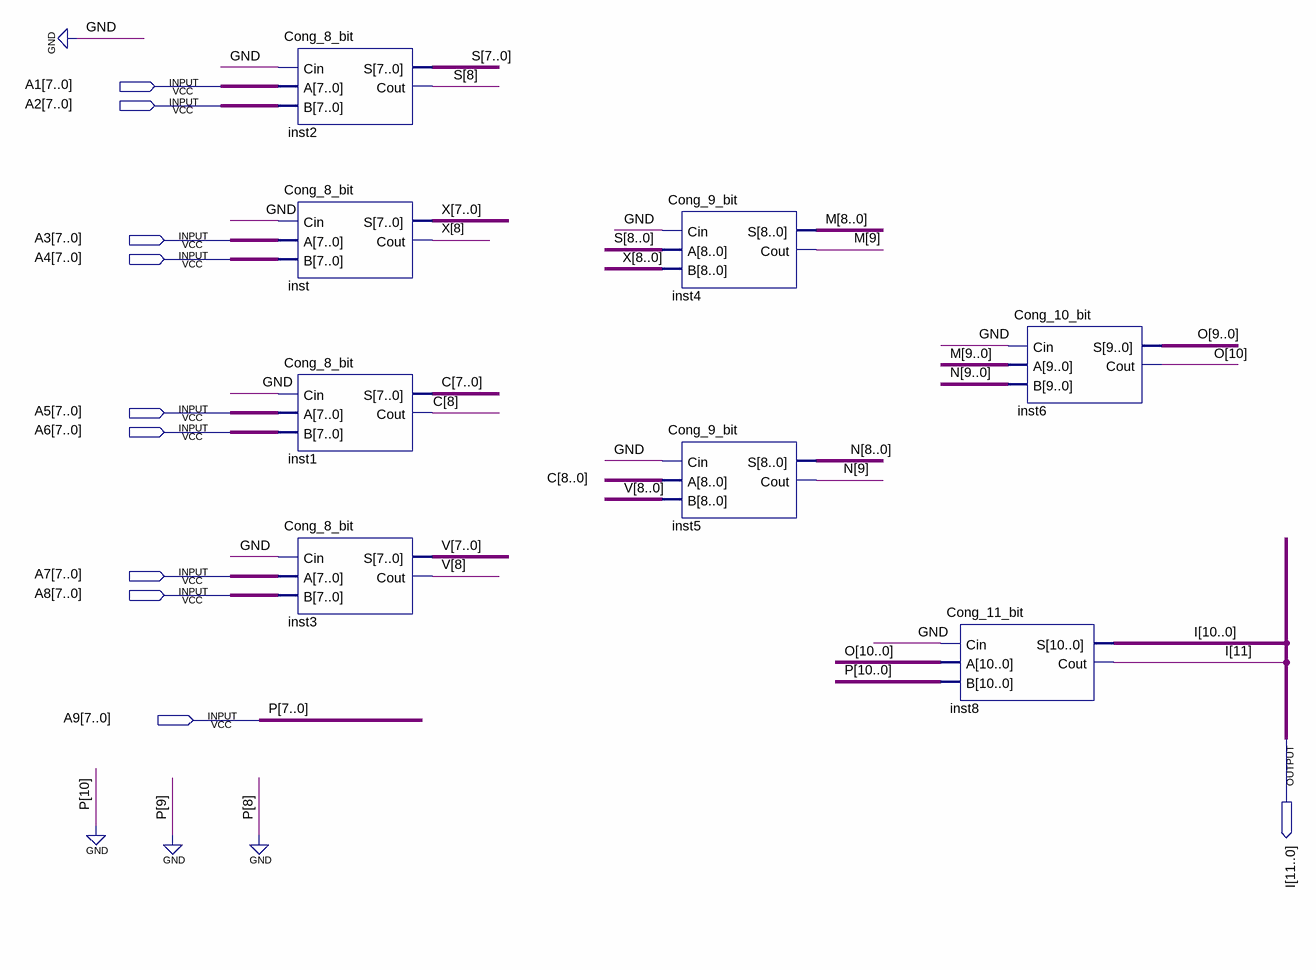
[diagram p0: schematic sheet]
// Quartus schematic 12bitadder.bdf as structural Verilog: 8 symbols, 10 pins
module \12bitadder  (
  input  [7:0] A1,
  input  [7:0] A2,
  input  [7:0] A3,
  input  [7:0] A4,
  input  [7:0] A5,
  input  [7:0] A6,
  input  [7:0] A7,
  input  [7:0] A8,
  input  [7:0] A9,
  output [11:0] I
);

  wire [8:0] C, S, V, X;
  wire [9:0] M, N;
  wire [10:0] O;

  Cong_8_bit inst2 (.Cin(1'b0), .A(A1), .B(A2), .S(S[7:0]), .Cout(S[8]));
  Cong_8_bit inst (.Cin(1'b0), .A(A3), .B(A4), .S(X[7:0]), .Cout(X[8]));
  Cong_8_bit inst1 (.Cin(1'b0), .A(A5), .B(A6), .S(C[7:0]), .Cout(C[8]));
  Cong_8_bit inst3 (.Cin(1'b0), .A(A7), .B(A8), .S(V[7:0]), .Cout(V[8]));
  Cong_9_bit inst4 (.Cin(1'b0), .A(S), .B(X), .S(M[8:0]), .Cout(M[9]));
  Cong_9_bit inst5 (.Cin(1'b0), .A(C), .B(V), .S(N[8:0]), .Cout(N[9]));
  Cong_10_bit inst6 (.Cin(1'b0), .A(M), .B(N), .S(O[9:0]), .Cout(O[10]));
  Cong_11_bit inst8 (.Cin(1'b0), .A(O), .B({3'b000, A9}), .S(I[10:0]), .Cout(I[11]));

  // Other names for the same wires on the sheet: P[7:0] = A9
endmodule
